# Altium schematic sheet Pomiar prądu i napięcia.SchDoc
size A4
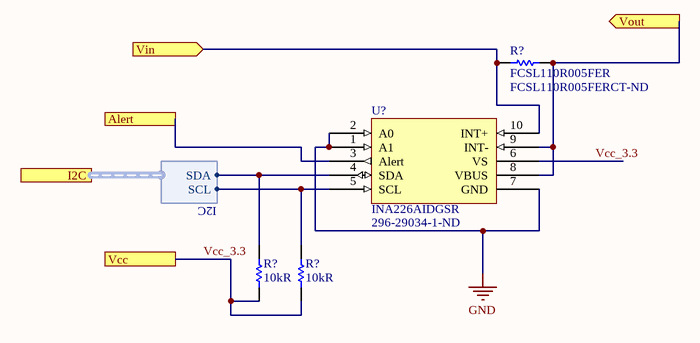
[diagram p0: Pomiar prądu i napięcia.SchDoc]

## Parts
(Parts that share a designator on the sheet are numbered #1, #2 ... from top to bottom, then left to right.)
R?#1  FCSL110R005FER  [FCSL110R005FERCT-ND]
R?#2  10kR  [RESC0603X02L]
R?#3  10kR  [RESC0603X02L]
U?  INA226AIDGSR  Supplier Part Number 1: 296-29034-1-ND  [INA226]

## Ports
Alert, I2C (harness I2C), Vcc, Vin (in), Vout (out)

## Harnesses
I2C: SCL, SDA

## Nets
GND: U?.1(A1) U?.2(A0) U?.7(GND)
Alert: U?.3(Alert) ; port Alert
Vcc_3.3: R?#2.1 R?#3.1 U?.6(VS) ; port Vcc
Vin: R?#1.1 U?.10(INT+) ; port Vin
Vout: R?#1.2 U?.8(VBUS) U?.9(INT-) ; port Vout
NetR?#2_2: R?#2.2 U?.4(SDA) ; port I2C.SDA
NetR?#3_2: R?#3.2 U?.5(SCL) ; port I2C.SCL

## Library data of the parts
R?#1 = FCSL110R005FER: RES SMD 5 MOHM 5W 4320 WIDE; Manufacturer: Ohmite; Tolerance: 1%; Resistance: 5mR; Temperature Coefficient: 50ppm/°C; Supplier 1: Digi-Key; Manufacturer Part Number: FCSL110R005FER; Stock 1: 3877; Pricing 1: 1 = 2,79000, 10 = 2,47700, 25 = 2,29720, 50 = 2,16220, 100 = 1,89190, 250 = 1,62164, 500 = 1,35136 (USD); RoHS: Yes; Case/Package: Metal; Number of Pins: 2; Min Operating Temperature: -55°C; Max Operating Temperature: 155°C; Packaging: Tape and Reel; Package Quantity: 1; Max Power Dissipation: 5W; Features: Moisture Resistant; Power Rating: 5W; Termination: SMD/SMT; Composition: Metal Foil; Number of Terminations: 2; Length: 0.197inch; Height: 0.028inch; Width: 11mm; Depth: 5mm; REACH SVHC: Unknown; ComponentLink1URL: https://datasheet.ciiva.com/2484/res-fcsl-2484643.pdf?src-supplier=Digi-Key; ComponentLink1Description: https://datasheet.ciiva.com/2484/res-fcsl-2484643.pdf?src-supplier=Digi-Key; ComponentLink2URL: https://datasheet.ciiva.com/2484/res-fcsl-2484644.pdf?src-supplier=Digi-Key; ComponentLink2Description: https://datasheet.ciiva.com/2484/res-fcsl-2484644.pdf?src-supplier=Digi-Key; ComponentLink3URL: https://datasheet.ciiva.com/2484/res-fcsl-2484645.pdf?src-supplier=Digi-Key; ComponentLink3Description: https://datasheet.ciiva.com/2484/res-fcsl-2484645.pdf?src-supplier=Digi-Key; ComponentLink4URL: https://datasheet.ciiva.com/6181/fcsl-6181333.pdf?src-supplier=Farnell; ComponentLink4Description: https://datasheet.ciiva.com/6181/fcsl-6181333.pdf?src-supplier=Farnell; ComponentLink5URL: https://datasheet.ciiva.com/46422/1812595-46422917.pdf?src-supplier=Element14; ComponentLink5Description: https://datasheet.ciiva.com/46422/1812595-46422917.pdf?src-supplier=Element14; ComponentLink6URL: https://datasheet.ciiva.com/8080/fcsl-8080343.pdf?src-supplier=Element14; ComponentLink6Description: https://datasheet.ciiva.com/8080/fcsl-8080343.pdf?src-supplier=Element14; Supplier Part Number 1: FCSL110R005FERCT-ND
R?#2 R?#3 = RC0201FR-0710KL: RES SMD 10K OHM 1% 1/20W 0201; Manufacturer: Yageo; Power Rating: 50mW; Voltage Rating: 25V; Temperature Coefficient: 200ppm/°C; Supplier 1: Digi-Key; Manufacturer Part Number: RC0201FR-0710KL; Stock 1: 10643192; Pricing 1: 1 = 0,10000, 10 = 0,04200, 100 = 0,01710, 1000 = 0,00768, 2500 = 0,00666, 5000 = 0,00551 (USD); RoHS: Yes; Case/Package: 0201; Number of Pins: 2; Weight: 6E-06oz; Case Code (Imperial): 0201; Case Code (Metric): 0603; Contact Plating: Tin,Matte; Min Operating Temperature: -55°C; Max Operating Temperature: 125°C; Resistance: 10kR; Tolerance: 1%; Packaging: Tape and Reel; Package Quantity: 1; Termination: SMD/SMT; Composition: Thick Film; Number of Terminations: 2; Military Standard: Not; Max Power Dissipation: 50mW; Voltage Rating (DC): 25V; Features: Moisture Resistant; Working Voltage: 25V; Length: 0.6mm; Height: 0.01inch; Width: 0.3mm; Depth: 0.3mm; Radiation Hardening: No; REACH SVHC: No SVHC; Lead Free: Lead Free; ComponentLink1URL: https://datasheet.ciiva.com/2467/pyu-r-int-thick-7-2467109.pdf?src-supplier=Digi-Key; ComponentLink1Description: https://datasheet.ciiva.com/2467/pyu-r-int-thick-7-2467109.pdf?src-supplier=Digi-Key; ComponentLink2URL: https://datasheet.ciiva.com/2467/pyu-r-int-thick-7-2467110.pdf?src-supplier=Digi-Key; ComponentLink2Description: https://datasheet.ciiva.com/2467/pyu-r-int-thick-7-2467110.pdf?src-supplier=Digi-Key; ComponentLink3URL: https://datasheet.ciiva.com/7660/1421516-7660807.pdf?src-supplier=Element14; ComponentLink3Description: https://datasheet.ciiva.com/7660/1421516-7660807.pdf?src-supplier=Element14; ComponentLink4URL: https://datasheet.ciiva.com/8891/pyu-rc0201-51-rohs-l-8-8891384.pdf?src-supplier=Avnet; ComponentLink4Description: https://datasheet.ciiva.com/8891/pyu-rc0201-51-rohs-l-8-8891384.pdf?src-supplier=Avnet; ComponentLink5URL: https://datasheet.ciiva.com/26829/getdatasheetpartid-421074-26829851.pdf?src-supplier=Verical; ComponentLink5Description: https://datasheet.ciiva.com/26829/getdatasheetpartid-421074-26829851.pdf?src-supplier=Verical; ComponentLink6URL: https://datasheet.ciiva.com/46391/1421516-46391339.pdf?src-supplier=Element14; ComponentLink6Description: https://datasheet.ciiva.com/46391/1421516-46391339.pdf?src-supplier=Element14; ComponentLink7URL: https://datasheet.ciiva.com/2467/pyu-r-int-thick-7-2467111.pdf?src-supplier=Digi-Key; ComponentLink7Description: https://datasheet.ciiva.com/2467/pyu-r-int-thick-7-2467111.pdf?src-supplier=Digi-Key; ComponentLink8URL: https://datasheet.ciiva.com/28405/pyu-rc0201-51-rohs-l-8-28405609.pdf?src-supplier=Avnet+Europe; ComponentLink8Description: https://datasheet.ciiva.com/28405/pyu-rc0201-51-rohs-l-8-28405609.pdf?src-supplier=Avnet+Europe; ComponentLink9URL: https://datasheet.ciiva.com/16855/pyu-rc0201-51-rohs-l-8-16855789.pdf?src-supplier=Avnet+Europe; ComponentLink9Description: https://datasheet.ciiva.com/16855/pyu-rc0201-51-rohs-l-8-16855789.pdf?src-supplier=Avnet+Europe; Supplier Part Number 1: 311-10.0KMCT-ND
U? = INA226AIDGSR: IC MONITOR PWR/CURR BIDIR 10MSOP; Manufacturer: Texas Instruments; Min Supply Voltage: 2.7V; Max Supply Voltage: 5.5V; Nominal Supply Current: 330uA; Common Mode Rejection Ratio: 140dB; Output Current: 10mA; Input Bias Current: 10uA; Input Offset Voltage (Vos): 2.5uV; Accuracy: 0.02%; Supplier 1: Digi-Key; Manufacturer Part Number: INA226AIDGSR; Stock 1: 62024; Pricing 1: 1 = 2,88000, 10 = 2,58900, 100 = 2,12100, 500 = 1,80554, 1000 = 1,52275 (USD); RoHS: Yes; Mount: Surface Mount; Case/Package: VSSOP; Number of Pins: 10; Contact Plating: Gold; Min Operating Temperature: -40°C; Max Operating Temperature: 125°C; Packaging: Tape and Reel; Package Quantity: 1; Radiation Hardening: No; REACH SVHC: No SVHC; Lead Free: Lead Free; ComponentLink1URL: https://datasheet.ciiva.com/1939/ina226-1939633.pdf?src-supplier=Digi-Key; ComponentLink1Description: https://datasheet.ciiva.com/1939/ina226-1939633.pdf?src-supplier=Digi-Key; ComponentLink2URL: https://datasheet.ciiva.com/4875/sbos547-126280-4875559.pdf?src-supplier=Mouser; ComponentLink2Description: https://datasheet.ciiva.com/4875/sbos547-126280-4875559.pdf?src-supplier=Mouser; ComponentLink3URL: https://datasheet.ciiva.com/1939/ina226-1939634.pdf?src-supplier=Digi-Key; ComponentLink3Description: https://datasheet.ciiva.com/1939/ina226-1939634.pdf?src-supplier=Digi-Key; ComponentLink4URL: https://datasheet.ciiva.com/1939/ina226-1939635.pdf?src-supplier=Digi-Key; ComponentLink4Description: https://datasheet.ciiva.com/1939/ina226-1939635.pdf?src-supplier=Digi-Key; ComponentLink5URL: https://datasheet.ciiva.com/14196/ina226-14196741.pdf?src-supplier=Avnet; ComponentLink5Description: https://datasheet.ciiva.com/14196/ina226-14196741.pdf?src-supplier=Avnet; ComponentLink6URL: https://datasheet.ciiva.com/22693/1840205-22693516.pdf?src-supplier=Element14; ComponentLink6Description: https://datasheet.ciiva.com/22693/1840205-22693516.pdf?src-supplier=Element14